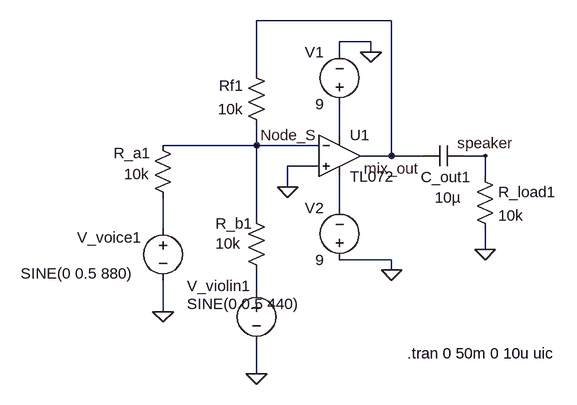
[diagram p0: schematic Draft3.asc]
Draft3.asc, the LTspice schematic file:
Version 4.1
SHEET 1 880 680
WIRE 416 -16 208 -16
WIRE 384 16 336 16
WIRE 336 32 336 16
WIRE 384 32 384 16
WIRE 208 64 208 -16
WIRE 336 160 336 112
WIRE 208 176 208 144
WIRE 208 176 64 176
WIRE 304 176 208 176
WIRE 416 192 416 -16
WIRE 416 192 368 192
WIRE 464 192 416 192
WIRE 560 192 528 192
WIRE 304 208 256 208
WIRE 560 224 560 192
WIRE 256 240 256 208
WIRE 336 272 336 224
WIRE 208 288 208 176
WIRE 64 304 64 256
WIRE 560 336 560 304
WIRE 416 352 336 352
WIRE 416 368 416 352
WIRE 208 400 208 368
WIRE 64 432 64 384
WIRE 208 528 208 480
FLAG 384 32 0
FLAG 416 368 0
FLAG 256 240 0
FLAG 208 528 0
FLAG 64 432 0
FLAG 208 176 Node_S
FLAG 416 192 mix_out
FLAG 560 336 0
FLAG 560 192 speaker
SYMBOL TL072 336 128 R0
SYMATTR InstName U1
SYMBOL voltage 336 128 R180
WINDOW 0 24 96 Left 2
WINDOW 3 24 16 Left 2
WINDOW 123 0 0 Left 0
WINDOW 39 0 0 Left 0
SYMATTR InstName V1
SYMATTR Value 9
SYMBOL voltage 336 368 R180
WINDOW 0 24 96 Left 2
WINDOW 3 24 16 Left 2
WINDOW 123 0 0 Left 0
WINDOW 39 0 0 Left 0
SYMATTR InstName V2
SYMATTR Value 9
SYMBOL voltage 64 288 R0
WINDOW 0 -132 30 Left 2
WINDOW 3 -219 85 Left 2
WINDOW 123 -101 76 Left 2
WINDOW 39 0 0 Left 0
SYMATTR InstName V_voice1
SYMATTR Value SINE(0 0.5 880)
SYMBOL voltage 208 384 R0
WINDOW 0 -107 8 Left 2
WINDOW 3 -107 36 Left 2
WINDOW 123 -86 55 Left 2
WINDOW 39 0 0 Left 0
SYMATTR InstName V_violin1
SYMATTR Value SINE(0 0.5 440)
SYMBOL res 48 160 R0
WINDOW 0 -2 28 Right 2
WINDOW 3 -44 60 Left 2
SYMATTR InstName R_a1
SYMATTR Value 10k
SYMBOL res 192 272 R0
WINDOW 0 -47 24 Left 2
WINDOW 3 -47 55 Left 2
SYMATTR InstName R_b1
SYMATTR Value 10k
SYMBOL res 224 160 R180
WINDOW 0 36 76 Left 2
WINDOW 3 36 40 Left 2
SYMATTR InstName Rf1
SYMATTR Value 10k
SYMBOL cap 528 176 R90
WINDOW 0 64 28 VBottom 2
WINDOW 3 65 25 VTop 2
SYMATTR InstName C_out1
SYMATTR Value 10µ
SYMBOL res 544 208 R0
SYMATTR InstName R_load1
SYMATTR Value 10k
TEXT 440 496 Left 2 !.tran 0 50m 0 10u uic

The netlist it stands for:
* Draft3.asc
* U1: TL072 (symbol TL072 not available, pins judged from their places): In+=0 In-=Node_S V+=N001 V-=N002 OUT=mix_out
V1 N001 0 9
V2 0 N002 9
V_voice1 N003 0 SINE(0 0.5 880)
V_violin1 N004 0 SINE(0 0.5 440)
R_a1 Node_S N003 10k
R_b1 Node_S N004 10k
Rf1 Node_S mix_out 10k
C_out1 speaker mix_out 10µ
R_load1 speaker 0 10k
.tran 0 50m 0 10u uic
.backanno
.end